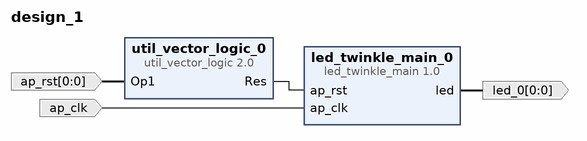
[diagram p0: block diagram of the top level]
# Vivado block design design_1, xc7z020clg400-1, Vivado 2020.2
create_bd_design design_1

create_bd_port -dir I -from 0 -to 0 ap_rst
create_bd_port -dir I -type clk ap_clk
create_bd_port -dir O -from 0 -to 0 -type data led_0

create_bd_cell -type ip -vlnv xilinx.com:hls:led_twinkle_main:1.0 led_twinkle_main_0
create_bd_cell -type ip -vlnv xilinx.com:ip:util_vector_logic:2.0 util_vector_logic_0
set_property -dict {CONFIG.C_OPERATION not CONFIG.C_SIZE 1} [get_bd_cells util_vector_logic_0]

# ---- connections ----

connect_bd_net [get_bd_pins util_vector_logic_0/Res] [get_bd_pins led_twinkle_main_0/ap_rst]
connect_bd_net -net Op1_0_1 [get_bd_ports ap_rst] [get_bd_pins util_vector_logic_0/Op1]
connect_bd_net -net ap_clk_0_1 [get_bd_ports ap_clk] [get_bd_pins led_twinkle_main_0/ap_clk]
connect_bd_net [get_bd_pins led_twinkle_main_0/led] [get_bd_ports led_0]

validate_bd_design
save_bd_design
